# EasyEDA Pro project 7寸FPC排线_立创文件.epro

# Schematic Schematic7
Board Name: Board2; Create Date: 2026-06-25; Page Name: P1; Project Name: 鲁班猫2RK2568; Schematic Name: Schematic7; Update Date: 2026-06-25; Company: 嘉立创EDA; Page Size: A5; Version: V1.0
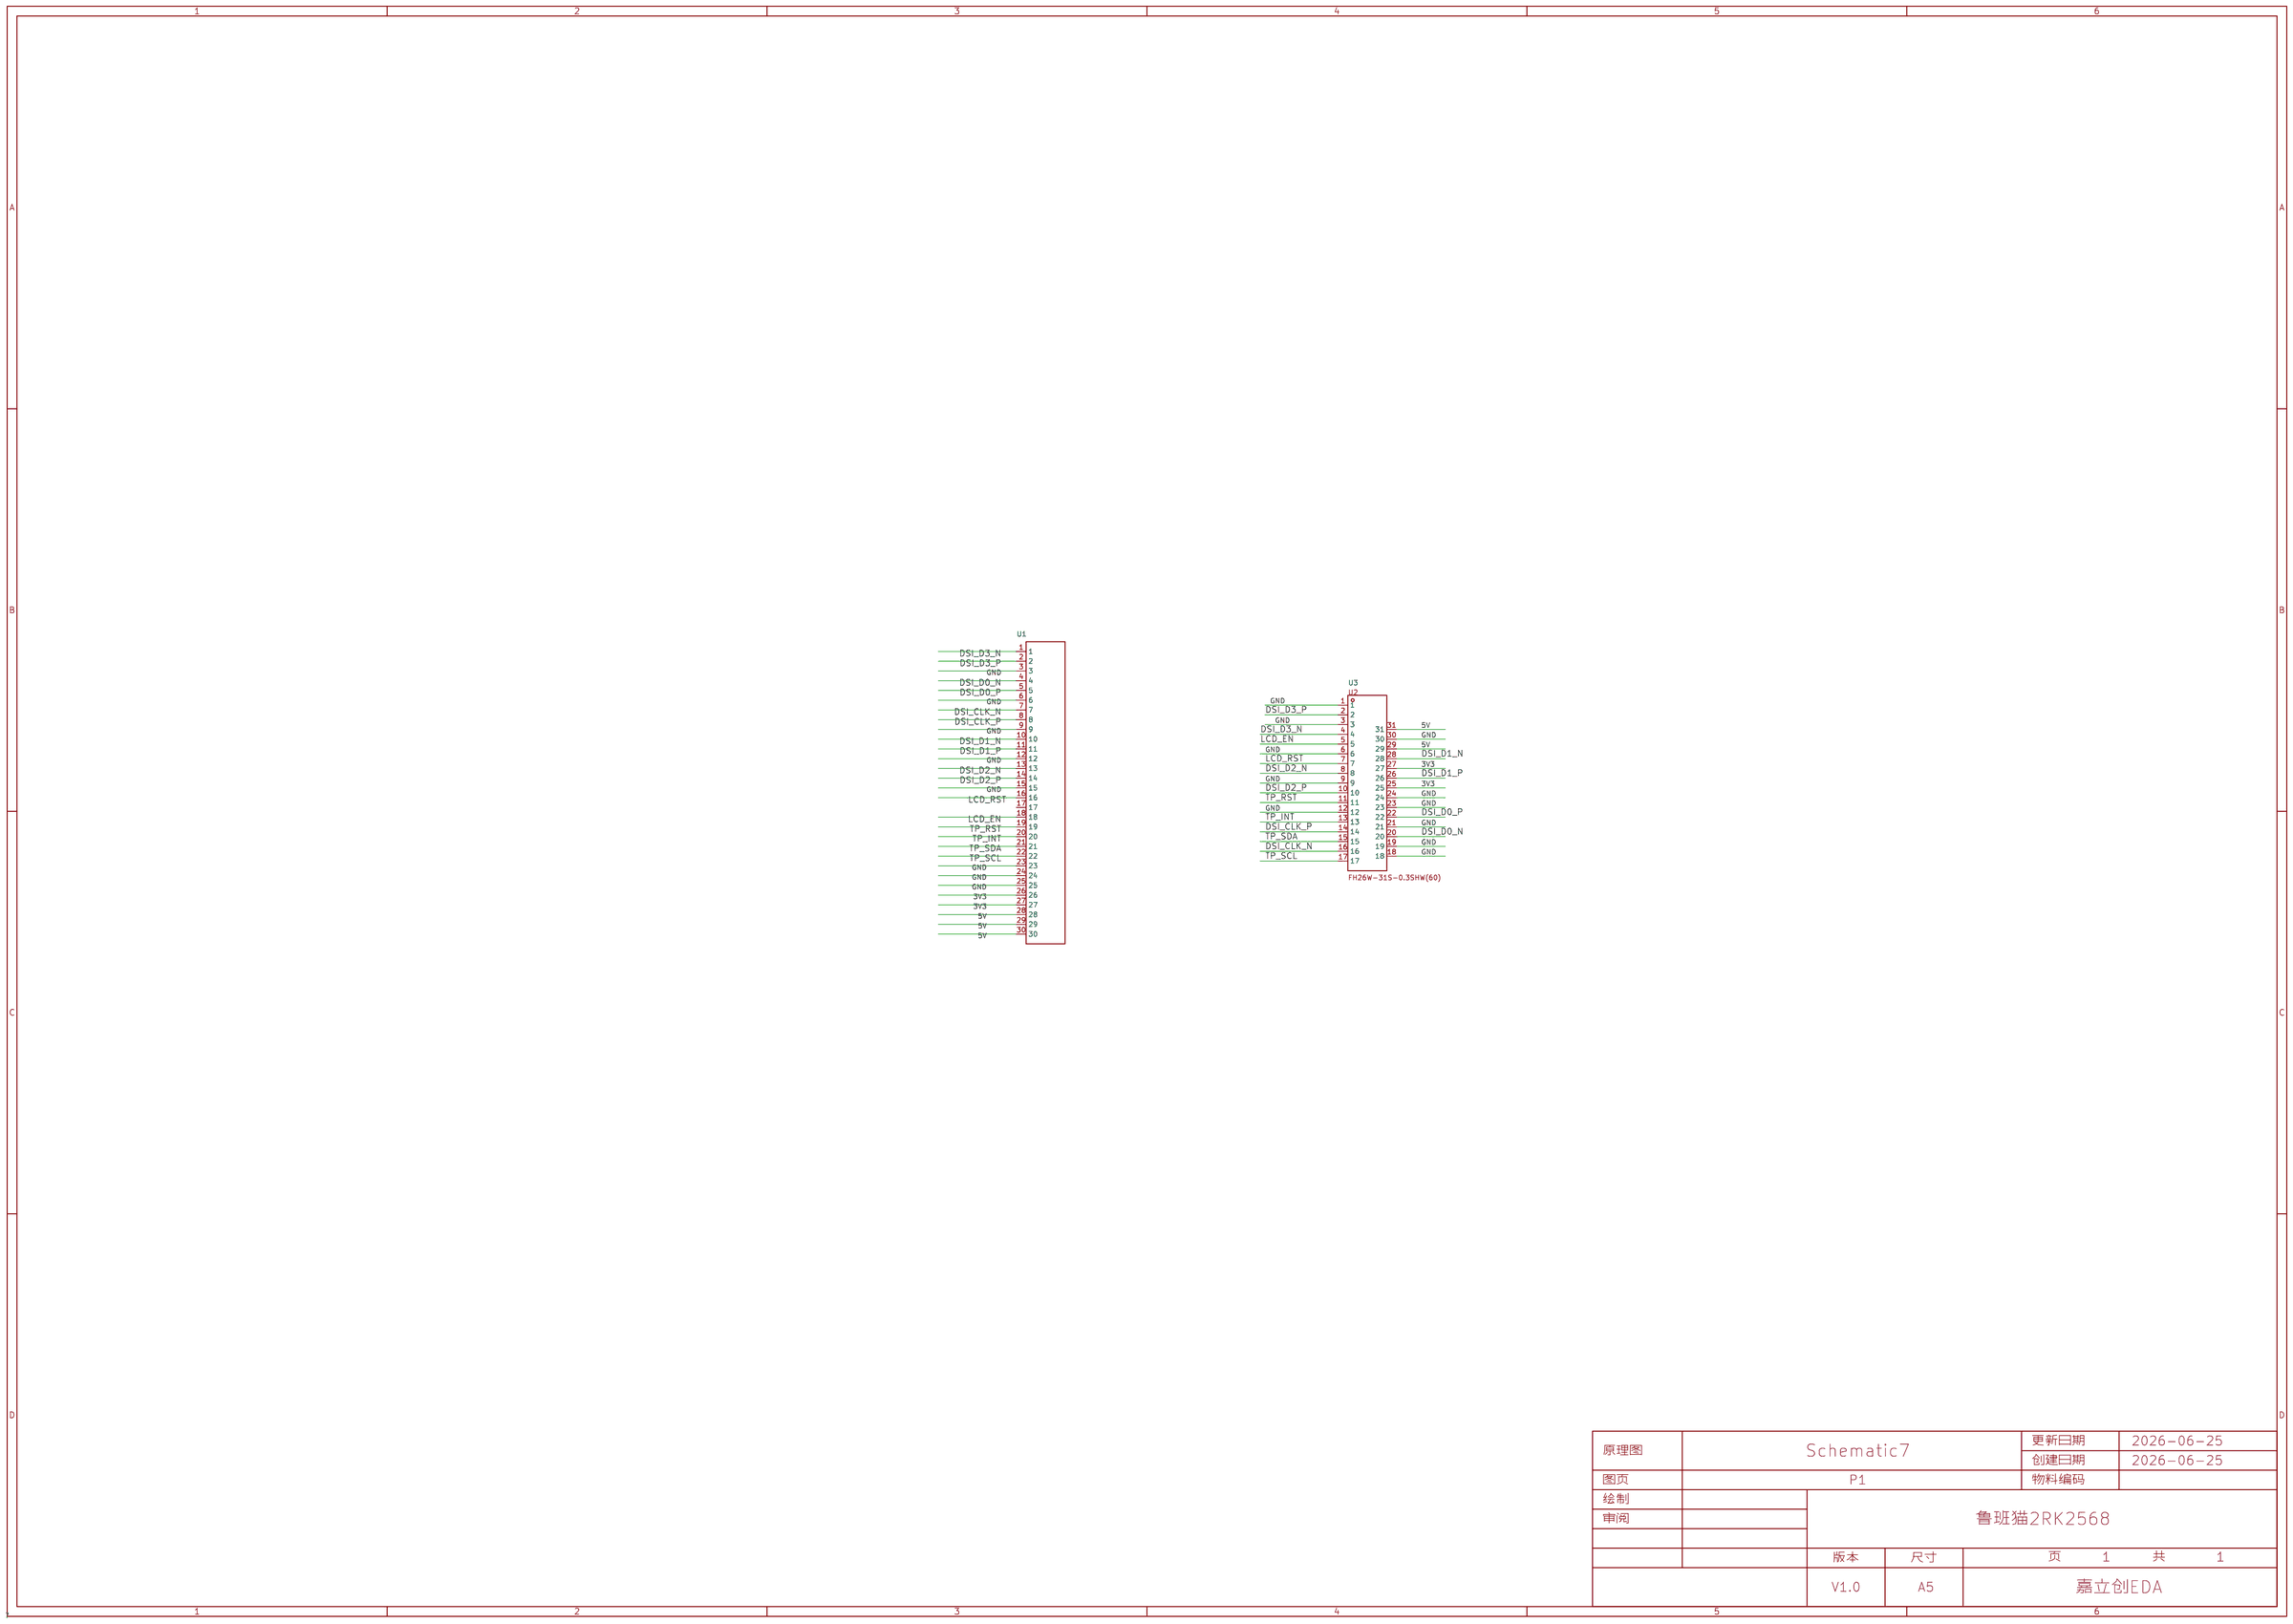
[diagram p0: schematic sheet]

## Parts
U1  -  [30P_0.5mm]
U3  -  [31P_0.3mm交错脚]

## Library data of the parts
U1 = FPC排线-0.5FX-30P
U3 = FPC连接-FH26W-31S-0.3SHW(60)

## Nets
3V3: U1.26 U1.27 U3.25 U3.27
5V: U1.28 U1.29 U1.30 U3.29 U3.31
GND: U1.3 U1.6 U1.9 U1.12 U1.15 U1.23 U1.24 U1.25 U3.1 U3.3 U3.6 U3.9 U3.12 U3.18 U3.19 U3.21 U3.23 U3.24 U3.30
DSI_CLK_N: U1.7 U3.16
DSI_CLK_P: U1.8 U3.14
DSI_D0_N: U1.4 U3.20
DSI_D0_P: U1.5 U3.22
DSI_D1_N: U1.10 U3.28
DSI_D1_P: U1.11 U3.26
DSI_D2_N: U1.13 U3.8
DSI_D2_P: U1.14 U3.10
DSI_D3_N: U1.1 U3.4
DSI_D3_P: U1.2 U3.2
LCD_EN: U1.18 U3.5
LCD_RST: U1.16 U3.7
TP_INT: U1.20 U3.13
TP_RST: U1.19 U3.11
TP_SCL: U1.22 U3.17
TP_SDA: U1.21 U3.15

Not connected (* = marked no-connect by the designer): U1 17

# Board PCB5
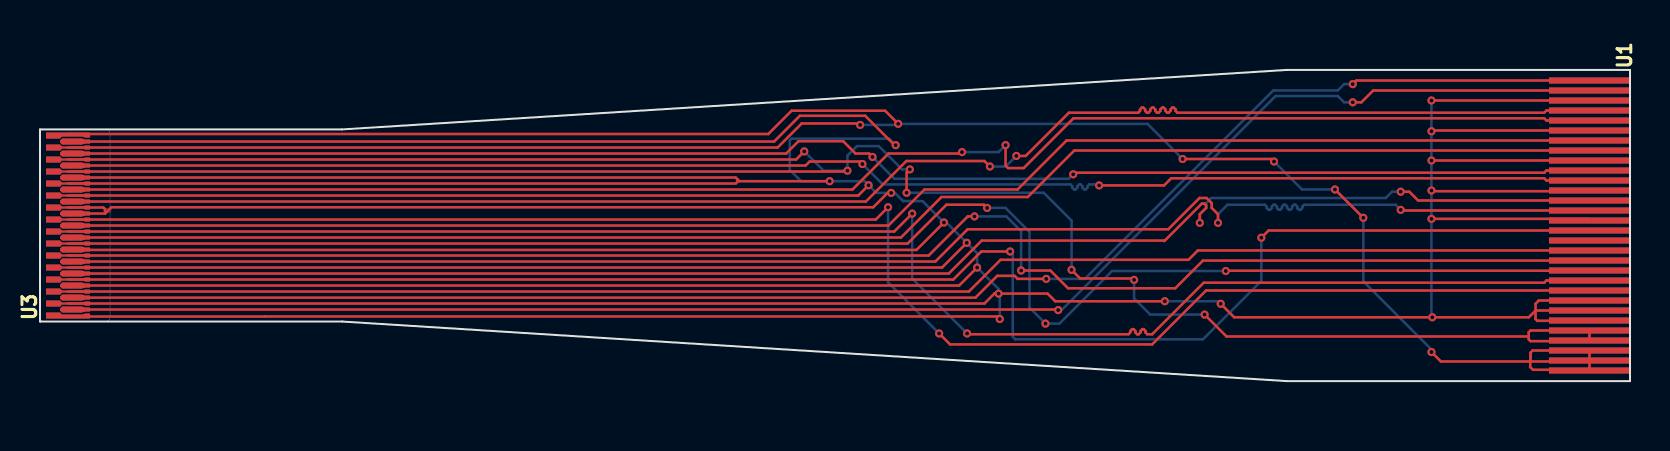
[diagram p1: board, top side]
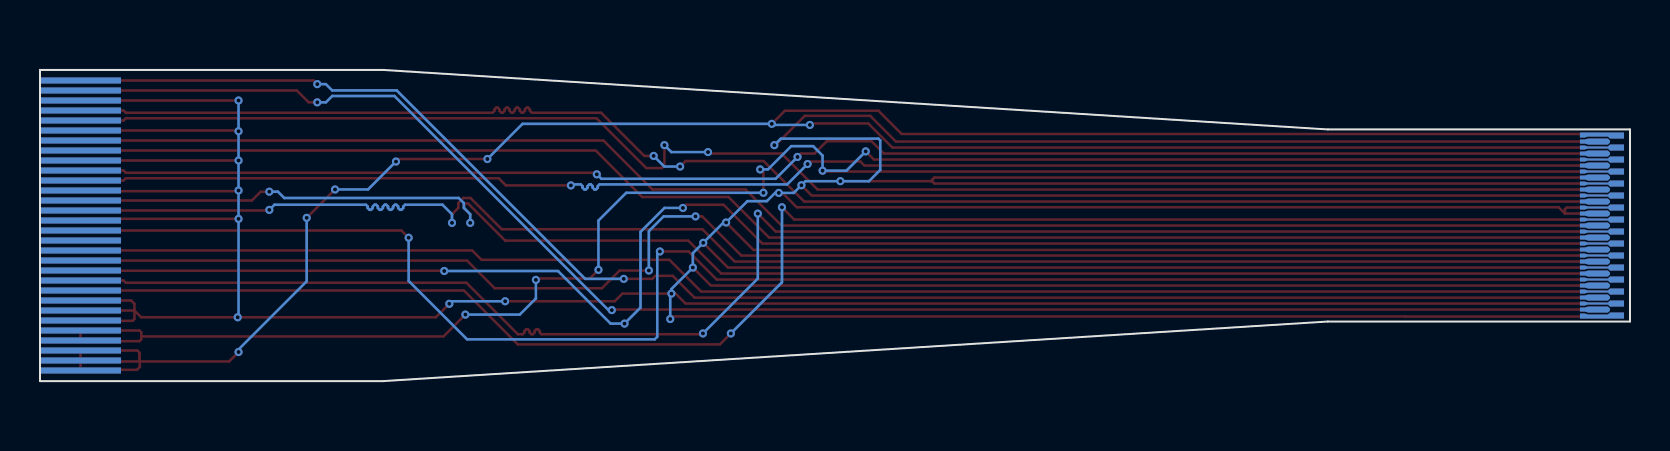
[diagram p2: board, bottom side, seen from below]

Outline 79.52 x 15.56 mm; copper layers: Top Layer, Bottom Layer. Coordinates in mm from the lower left corner of the outline.
Outline path: 0,12.58 15.11,12.58 62.35,15.56 79.52,15.56 79.52,0 62.35,0 15.11,2.98 0,2.98 0,12.58
Stack: Top Layer 0.012mm - / Dielectric1 0.025mm PI / Bottom Layer 0.012mm -

## Design rules (mm)
net DSI_D3_P: DP5
net DSI_D3_N: DP5
net DSI_D2_N: DP4
net DSI_D2_P: DP4
net DSI_CLK_P: DP3
net TP_SDA: DP6
net DSI_CLK_N: DP3
net TP_SCL: DP6
net DSI_D0_N: DP2
net DSI_D0_P: DP2
net DSI_D1_P: DP1
net DSI_D1_N: DP1
spacing copperThickness1oz (default): track to track 0.102, other pairs 0 to 0.3
spacing copperThickness2oz: track to track 0.203, other pairs 0.152 to 0.3
track width copperThickness1oz (default): min 0.127, default 0.254, max 2.54
track width copperThickness2oz: min 0.203, default 0.254, max 2.54
track width POWER: min 0.254, default 0.254, max 2.54
differential pair differentialPair (default): width min 0.127, default 0.254, max 2.54; gap min 0.152, default 0.152
net GND uses copperRegion

## Placement (name value [footprint] x y rotation side)
U1  -  [30P_0.5mm]  73.04 15.56 270 top
U3  -  [31P_0.3mm交错脚]  3.55 2.98 90 top

## Footprints (pads in the part's own frame, mm; a bottom-side part is the same pattern mirrored in y, then rotated)
30P_0.5mm
  rect 0.3x4.05 hole 0.001: 1(0.529,4.455) 2(1.03,4.455) 3(1.53,4.455) 4(2.03,4.455) 5(2.53,4.455) 6(3.03,4.455) 7(3.53,4.455) 8(4.029,4.455) 9(4.529,4.455) 10(5.029,4.455) 11(5.529,4.455) 12(6.029,4.455) 13(6.529,4.455) 14(7.029,4.455) 15(7.529,4.455) 16(8.03,4.455) 17(8.53,4.455) 18(9.03,4.455) 19(9.53,4.455) 20(10.03,4.455) 21(10.53,4.455) 22(11.03,4.455) 23(11.53,4.455) 24(12.03,4.455) 25(12.53,4.455) 26(13.03,4.455) 27(13.53,4.455) 28(14.03,4.455) 29(14.53,4.455) 30(15.03,4.455)
31P_0.3mm交错脚
  custom 0.3x2.204 hole 0.001: 1(0.252,2.145)
  custom 0.298x1.501 hole 0.001: 2(0.601,1.793) 4(1.2,1.793) 6(1.8,1.793) 8(2.401,1.793) 10(3.001,1.793) 12(3.6,1.793) 14(4.2,1.793) 16(4.801,1.793) 18(5.401,1.793) 20(6,1.793) 22(6.601,1.793) 24(7.2,1.793) 26(7.801,1.793) 28(8.4,1.793)
  custom 0.301x2.203 hole 0.001: 3(0.901,2.144) 5(1.502,2.144) 7(2.102,2.144) 9(2.701,2.144) 11(3.301,2.144) 13(3.901,2.144) 15(4.502,2.144) 17(5.101,2.144) 19(5.702,2.144) 21(6.301,2.144) 23(6.902,2.144) 25(7.502,2.144) 27(8.101,2.144) 29(8.701,2.144)
  custom 0.299x1.501 hole 0.001: 30(9.001,1.793)
  custom 0.301x2.205 hole 0.001: 31(9.351,2.144)

## Nets
As in the schematic.

Pads without a net: U1 17

## Via types
v1: diameter 0.406, hole 0.203, Top Layer to Bottom Layer, 58 vias

## Routing (per net, layer and track width the routed paths; a pad name or vN(x,y) marks a point on that pad's centre or on a via; arc(x,y) is an arc through that point)
3V3: length 127.3
  Top Layer w0.127: 54.66,5.13 52.02,5.13 v1(51.59,5.56) ; v1(38.22,11.49) 37.82,11.08 U3.27 ; v1(58.25,3.33) 59.34,2.23 74.45,2.23 ; v1(43.5,10.59) 43.5,10.6 43.34,10.43 v1(43.34,9.42) ; v1(40.38,10.52) 40.34,10.48 U3.25 ; 74.46,2.44 74.46,2.09 74.55,2 77.46,2 U1.27 U1.26 74.55,2.53 74.46,2.44
  Bottom Layer w0.127: v1(38.22,11.49) 39.19,10.52 v1(40.38,10.52) 40.38,11.28 40.86,11.75 41.95,11.75 43.11,10.59 v1(43.5,10.59) ; v1(51.59,5.56) 51.59,8.03 50.2,9.42 v1(43.34,9.42) ; v1(58.25,3.33) 55.53,3.33 54.72,4.13 v1(54.72,5.06)
5V: length 133.8
  Top Layer w0.127: 74.54,0.98 74.53,0.7 ; 74.54,0.98 70.07,0.98 v1(69.59,1.45) ; 74.54,0.98 74.55,1.38 ; U3.29 36.89,11.68 38.1,12.88 40.94,12.88 v1(41.02,12.81) ; 74.62,0.98 77.45,0.98 U1.29 ; 74.53,0.71 74.67,0.56 77.46,0.56 U1.30 U1.29 ; v1(61.72,10.98) 61.59,11.11 v1(57.15,11.11) ; v1(64.77,9.58) v1(66.18,8.16) ; U3.31 1.43,12.36 36.43,12.36 37.59,13.52 42.27,13.52 v1(42.92,12.86) ; U1.29 U1.28 74.65,1.53 74.55,1.43 74.55,1.38 ; 74.55,1.38 74.55,1.07
  Bottom Layer w0.127: v1(64.77,9.58) 63.12,9.58 v1(61.72,10.98) ; v1(69.59,1.45) 69.59,1.58 66.18,4.99 v1(66.18,8.16) ; v1(57.15,11.11) 55.39,12.86 v1(42.92,12.86) 42.87,12.81 v1(41.02,12.81)
GND: length 534.3
  Top Layer w0.127: v1(69.59,12.49) 69.63,12.53 U1.6 ; v1(59.05,3.87) 59.73,3.19 v1(69.64,3.19) 74.46,3.19 74.8,3.53 ; U3.6 45.97,4.78 v1(46.87,5.68) ; v1(41.44,9.79) 40.93,9.28 U3.21 ; 3.26,8.38 3.57,8.69 41.67,8.69 42.39,9.41 v1(42.57,9.41) ; 3.26,8.38 U3.18 ; 3.26,8.38 3.26,8.59 3.17,8.68 U3.19 ; U3.30 36.72,11.98 38,13.26 41.27,13.26 42.74,11.8 v1(42.8,11.8) ; U3.24 34.8,10.18 34.88,10.09 ; v1(69.59,9.53) 69.63,9.5 77.46,9.5 U1.12 ; 74.8,3.53 74.8,3.1 74.89,3.01 77.48,3.01 U1.25 ; 74.8,3.53 U1.24 ; 74.8,3.53 74.8,3.87 74.96,4.03 U1.23 ; U3.3 47.23,3.88 47.73,4.37 v1(47.94,4.37) 50.39,4.37 50.77,3.99 v1(56.26,3.99) ; 34.88,10.09 34.88,9.97 34.8,9.88 U3.23 ; 34.88,10.09 34.98,10 v1(39.49,10) ; U3.1 11.23,3.23 11.23,3.23 47.88,3.23 v1(48,3.1) ; v1(69.59,8.11) 77.41,8.11 U1.15 ; v1(46.35,6.91) 45.12,5.68 U3.9 ; U3.12 1.77,6.56 43.84,6.56 v1(45.21,7.93) ; U1.3 v1(69.59,14.03) ; U1.9 v1(69.59,11.03)
  Bottom Layer w0.127: v1(42.8,11.8) 42.47,12.12 37.59,12.12 37.5,12.03 37.5,10.56 38.06,10 v1(39.49,10) 41.24,10 v1(41.44,9.79) 41.82,9.41 v1(42.57,9.41) 42.76,9.41 43.17,9 44.14,9 v1(45.21,7.93) 45.34,7.93 v1(46.35,6.91) 46.87,6.4 v1(46.87,5.68) 47.94,4.6 v1(47.94,4.37) 48,4.32 v1(48,3.1) ; v1(69.59,14.03) v1(69.59,12.49) v1(69.59,11.03) v1(69.59,9.53) v1(69.59,8.11) 69.59,3.23 v1(69.64,3.19) ; v1(59.05,3.87) 58.92,3.99 v1(56.26,3.99)
DSI_CLK_N: length 77.5
  Top Layer w0.127: U3.16 42.43,7.78 44.24,9.58 48.89,9.58 48.89,9.58 51.34,12.03 U1.7
DSI_CLK_P: length 77.5
  Top Layer w0.127: U1.8 51.73,11.53 49.41,9.21 45.09,9.21 43.06,7.18 U3.14
DSI_D0_N: length 79
  Top Layer w0.127: U3.20 41.3,8.98 43.33,11 47.23,11 v1(47.51,10.73) ; v1(48.83,11.26) 49.3,11.26 51.46,13.42 54.93,13.42 55.02,13.51 55.02,13.58 55.11,13.67 55.18,13.67 55.27,13.58 55.27,13.51 55.36,13.42 55.44,13.42 55.53,13.51 55.53,13.58 55.62,13.67 55.69,13.67 55.78,13.58 55.78,13.51 55.87,13.42 55.94,13.42 56.03,13.51 56.03,13.58 56.12,13.67 56.2,13.67 56.29,13.58 56.29,13.51 56.38,13.42 56.45,13.42 56.54,13.51 56.54,13.58 56.63,13.67 56.71,13.67 56.8,13.58 56.8,13.51 56.89,13.42 75.23,13.42 75.34,13.53 U1.4
  Bottom Layer w0.127: v1(48.83,11.26) 48.3,10.73 v1(47.51,10.73)
DSI_D0_P: length 78.8
  Top Layer w0.127: v1(48.29,11.8) 48.29,10.78 48.42,10.65 49.2,10.65 51.69,13.14 75.23,13.14 75.34,13.03 U1.5 ; U3.22 40.63,9.58 42.43,11.38 46.04,11.38 v1(46.11,11.45)
  Bottom Layer w0.127: v1(48.29,11.8) 47.95,11.45 v1(46.11,11.45)
DSI_D1_N: length 76.9
  Top Layer w0.127: U3.28 37.32,11.38 37.94,11.99 40.17,11.99 40.79,11.38 41.47,11.38 v1(41.64,11.21) ; U1.10 75.34,10.53 75.23,10.42 51.75,10.42 v1(51.67,10.34)
  Bottom Layer w0.127: v1(41.64,11.21) 42.73,10.12 51.45,10.12 v1(51.67,10.34)
DSI_D1_P: length 77.1
  Top Layer w0.127: v1(41.13,10.85) 41.01,10.98 38.49,10.98 38.29,10.78 U3.26 ; v1(52.97,9.79) 56.22,9.79 56.58,10.14 75.23,10.14 75.34,10.03 U1.11
  Bottom Layer w0.127: v1(41.13,10.85) 42.15,9.84 51.54,9.84 51.63,9.75 51.63,9.67 51.72,9.58 51.79,9.58 51.88,9.67 51.88,9.75 51.97,9.84 52.05,9.84 52.14,9.75 52.14,9.67 52.23,9.58 52.3,9.58 52.39,9.67 52.39,9.75 52.48,9.84 52.92,9.84 v1(52.97,9.79)
DSI_D2_N: length 79.8
  Top Layer w0.127: v1(68.05,9.47) 68.49,9.47 68.93,9.03 U1.13 ; U3.8 45.45,5.38 47.1,7.02 56.22,7.02 56.24,7.01 58.11,8.88 58.23,8.88 58.32,8.79 58.32,8.66 58.01,8.34 v1(58.01,7.91)
  Bottom Layer w0.127: v1(68.05,9.47) 67.62,9.47 67.31,9.16 58.58,9.16 58.32,8.9 58.32,8.66 58.01,8.34 v1(58.01,7.91)
DSI_D2_P: length 79.9
  Top Layer w0.127: v1(58.92,7.91) 58.92,8.34 58.6,8.66 58.6,8.9 58.35,9.16 57.99,9.16 56.43,7.59 46.39,7.59 44.78,5.98 U3.10 ; U1.14 68.08,8.53 v1(68.05,8.56)
  Bottom Layer w0.127: v1(58.92,7.91) 58.92,8.34 59.39,8.82 61.27,8.82 61.36,8.73 61.36,8.66 61.45,8.57 61.52,8.57 61.61,8.66 61.61,8.73 61.7,8.82 61.77,8.82 61.86,8.73 61.86,8.66 61.95,8.57 62.03,8.57 62.12,8.66 62.12,8.73 62.21,8.82 62.28,8.82 62.37,8.73 62.37,8.66 62.46,8.57 62.54,8.57 62.63,8.66 62.63,8.73 62.72,8.82 62.79,8.82 62.88,8.73 62.88,8.66 62.97,8.57 63.04,8.57 63.13,8.66 63.13,8.73 63.22,8.82 67.8,8.82 v1(68.05,8.56)
DSI_D3_N: length 80.4
  Top Layer w0.127: U1.1 65.84,15.03 v1(65.66,14.85) ; U3.4 1.76,4.17 46.79,4.17 47.88,5.26 48.74,5.26 48.9,5.11 v1(50.33,5.11)
  Bottom Layer w0.127: v1(50.33,5.11) 52.26,5.11 61.68,14.53 64.91,14.53 65.22,14.85 v1(65.66,14.85)
DSI_D3_P: length 80.6
  Top Layer w0.127: v1(50.92,3.55) 50.9,3.58 U3.2 ; U1.2 66.68,14.53 66.09,13.94 v1(65.66,13.94)
  Bottom Layer w0.127: v1(50.92,3.55) 50.96,3.51 51.05,3.51 61.8,14.26 64.91,14.26 65.22,13.94 v1(65.66,13.94)
LCD_EN: length 76.9
  Top Layer w0.127: U1.18 77.49,6.53 57.91,6.53 57.44,6.06 48.04,6.06 46.46,4.48 U3.5
LCD_RST: length 84.4
  Top Layer w0.127: U1.16 61.45,7.53 v1(61.08,7.17) ; v1(48.52,6.48) 47.08,6.48 45.68,5.08 U3.7
  Bottom Layer w0.127: v1(61.08,7.17) 61.08,5.01 58.16,2.09 48.78,2.09 48.65,2.22 48.65,6.35 v1(48.52,6.48)
TP_INT: length 82.7
  Top Layer w0.127: v1(47.37,8.66) 47.21,8.82 45.34,8.82 43.4,6.88 U3.13 ; U1.20 77.48,5.52 59.31,5.52
  Bottom Layer w0.127: v1(47.37,8.66) 48.29,8.66 49.49,7.46 49.49,3.67 v1(50.29,2.88) 50.99,2.88 53.61,5.51 v1(59.31,5.51)
TP_RST: length 80.1
  Top Layer w0.127: U3.11 44.45,6.28 46.4,8.23 v1(46.74,8.23) ; v1(49.07,5.53) 50.53,5.53 51.42,4.64 56.78,4.64 58.16,6.03 77.49,6.03 U1.19
  Bottom Layer w0.127: v1(46.74,8.23) 48.33,8.23 49.07,7.5 v1(49.07,5.53)
TP_SCL: length 82.5
  Top Layer w0.127: v1(42.42,8.69) 41.8,8.08 U3.17 ; v1(44.97,2.38) 45.52,1.83 55.62,1.83 58.32,4.53 U1.22
  Bottom Layer w0.127: v1(44.97,2.38) 42.42,4.94 v1(42.42,8.69)
TP_SDA: length 82.6
  Top Layer w0.127: U3.15 42.73,7.48 v1(43.62,8.38) ; v1(46.37,2.38) 46.41,2.34 54.44,2.34 54.53,2.43 54.53,2.51 54.62,2.6 54.69,2.6 54.78,2.51 54.78,2.43 54.87,2.34 54.95,2.34 55.04,2.43 55.04,2.51 55.13,2.6 55.2,2.6 55.29,2.51 55.29,2.43 55.38,2.34 55.62,2.34 58.2,4.92 75.23,4.92 75.34,5.03 U1.21
  Bottom Layer w0.127: v1(46.37,2.38) 43.62,5.13 v1(43.62,8.38)

## Copper pours and planes (outline as drawn; the poured copper is in the pictures)
GND on Top Layer: 3.44,12.58 15.11,12.58 62.35,15.56 74.42,15.55 74.45,0 62.35,0 15.11,2.98 3.48,2.98
GND on Bottom Layer: 3.44,12.58 15.11,12.58 62.35,15.56 74.42,15.55 74.45,0 62.35,0 15.11,2.98 3.48,2.98

Small or netless copper shapes (teardrops, artwork), in the pictures only: 1 on Top Layer
